# Altium schematic sheet 40_Storage.SchDoc: Almacenamiento
size A4; DrawnBy: Mateo Cárdenas; Revision: Rev A; SheetNumber: 5; SheetTotal: 7
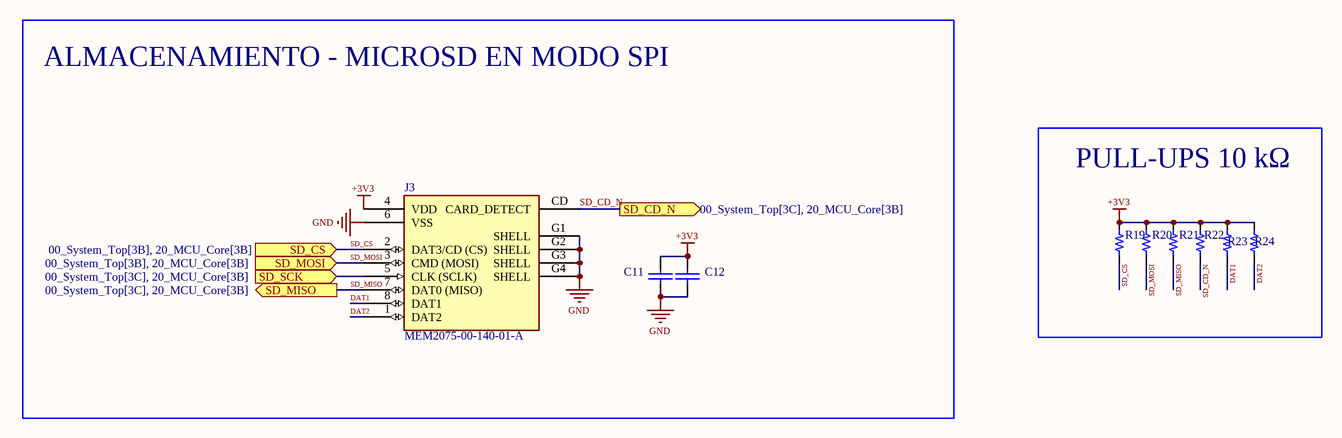
[diagram p0: 40_Storage.SchDoc]

## Parts
C11  0.1uF 50V  [0603_cap]  (value not drawn)
C12  10uF 10V  [0603_cap]  (value not drawn)
J3  MEM2075-00-140-01-A  [MicroSD_GCT_MEM2075-00-140-01-A]
R19  10k 1/10W  [0603_res]  (value not drawn)
R20  10k 1/10W  [0603_res]  (value not drawn)
R21  10k 1/10W  [0603_res]  (value not drawn)
R22  10k 1/10W  [0603_res]  (value not drawn)
R23  10k 1/10W  [0603_res]  (value not drawn)
R24  10k 1/10W  [0603_res]  (value not drawn)

## Blocks framed on the sheet
ALMACENAMIENTO - MICROSD EN MODO SPI: C11 C12 J3
PULL-UPS 10 kΩ: R19-R24

## Ports
SD_CD_N (out, see 00_System_Top[3C], 20_MCU_Core[3B]), SD_CS (in, see 00_System_Top[3B], 20_MCU_Core[3B]), SD_MISO (out, see 00_System_Top[3C], 20_MCU_Core[3B]), SD_MOSI (in, see 00_System_Top[3B], 20_MCU_Core[3B]), SD_SCK (in, see 00_System_Top[3C], 20_MCU_Core[3B])

## Nets
+3V3: C11.1 C12.1 J3.4(VDD) R19.2 R20.2 R21.2 R22.2 R23.1 R24.1
GND: C11.2 C12.2 J3.6(VSS) J3.G1(SHELL) J3.G2(SHELL) J3.G3(SHELL) J3.G4(SHELL)
DAT1: J3.8(DAT1) R23.2
DAT2: J3.1(DAT2) R24.2
SD_CD_N: J3.CD(CARD_DETECT) R22.1 ; port SD_CD_N
SD_CS: J3.2(DAT3/CD_(CS)) R19.1 ; port SD_CS
SD_MISO: J3.7(DAT0_(MISO)) R21.1 ; port SD_MISO
SD_MOSI: J3.3(CMD_(MOSI)) R20.1 ; port SD_MOSI
SD_SCK: J3.5(CLK_(SCLK)) ; port SD_SCK

## Library data of the parts
C11 = Cap_0.1uF_0603_50V: 50V 100nF Y5V -20%~+80% 0603 Multilayer Ceramic Capacitors MLCC - SMD/SMT ROHS; Manufacturer: Walsin Tech Corp; Manufacturer Part Number: 0603F104Z500CT; Supplier 1: LCSC; Supplier Part Number 1: C83060; ComponentLink1Description: LCSC; ComponentLink1URL: https://www.lcsc.com/product-detail/Multilayer-Ceramic-Capacitors-MLCC-SMD-SMT_Walsin-Tech-Corp-0603F104Z500CT_C83060.html; Value: 0.1uF
C12 = Cap_10uF_0603_10V: 10V 10uF X5R ±10% 0603 Multilayer Ceramic Capacitors MLCC - SMD/SMT ROHS; Manufacturer: CCTC; Manufacturer Part Number: TCC0603X5R106K100CT; Supplier 1: LCSC; Supplier Part Number 1: C380314; ComponentLink1Description: LCSC; ComponentLink1URL: https://www.lcsc.com/product-detail/Multilayer-Ceramic-Capacitors-MLCC-SMD-SMT_CCTC-TCC0603X5R106K100CT_C380314.html; Value: 10uF
J3 = MEM2075-00-140-01-A: GCT MEM2075 microSD push-push socket. Normally-open card detect: CD closes to SHELL when a card is inserted.; Verification: Pinout and land pattern from datasheet; not yet built or tested; Manufacturer: GCT; Manufacturer Part Number: MEM2075-00-140-01-A; Datasheet: gct.co/files/drawings/mem2075.pdf rev A1
R19-R24 = Res_10k_0603_1/10W: RES SMD 10k OHM 5% 1/10W 0603; Manufacturer: FOJAN; Manufacturer Part Number: FRC0603J103TS; ComponentLink1URL: https://www.lcsc.com/product-detail/Chip-Resistor-Surface-Mount_FOJAN-FRC0603J103TS_C2930027.html; Supplier 1: LCSC; Supplier Part Number 1: C2930027; ComponentLink1Description: LCSC; Value: 10k